# Altium schematic sheet Power-Sheet.SchDoc
size A4; SheetNumber: 2; SheetTotal: 11
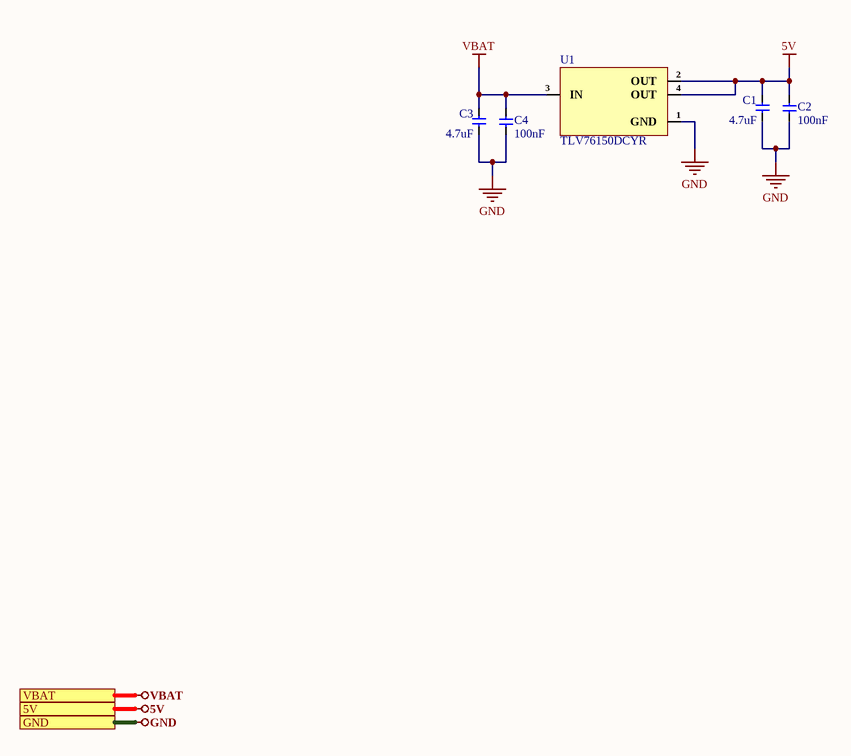
[diagram p0: Power-Sheet.SchDoc]

## Parts
C1  4.7uF  [Cap-0805]
C2  100nF  [cap-0402]
C3  4.7uF  [Cap-0805]
C4  100nF  [cap-0402]
U1  TLV76150DCYR  [SOT- 223]

## Ports
5V (see Top-Sheet[1A], Electrode-Sheet1[3D], Electrode-Sheet2[3D], Electrode-Sheet3[3D], Electrode-Sheet4[3D], Electrode-Sheet5[3D], Electrode-Sheet6[3D], Electrode-Sheet7[3D], Electrode-Sheet8[3D], Opamp-Sheet2[1D]), GND (see Top-Sheet[1A], Connector-Sheet[1D], Electrode-Sheet1[3D], Electrode-Sheet2[3D], Electrode-Sheet3[3D], Electrode-Sheet4[3D], Electrode-Sheet5[3D], Electrode-Sheet6[3D], Electrode-Sheet7[3D], Electrode-Sheet8[3D], Opamp-Sheet2[1D]), VBAT (see Top-Sheet[1A], Connector-Sheet[1D], Electrode-Sheet1[3D], Electrode-Sheet2[3D], Electrode-Sheet3[3D], Electrode-Sheet4[3D], Electrode-Sheet5[3D], Electrode-Sheet6[3D], Electrode-Sheet7[3D], Electrode-Sheet8[3D])

## Nets
5V: C1.1 C2.2 U1.2(OUT) U1.4(OUT) ; port 5V
GND: C1.2 C2.1 C3.2 C4.1 U1.1(GND) ; port GND
VBAT: C3.1 C4.2 U1.3(IN) ; port VBAT

## Notes on the sheet
- File:
- Title:
- Date:
- Page
- Num:
- Total:
- Drawn By: Huzaifa Ali

## Library data of the parts
C1 C3 = CL21B475KAFNNNE: CAP CER 4.7UF 25V X7R 0805; Manufacturer: Samsung; Item Type: Capacitors; Material: 4241ConductorMaterial; Tolerance: 10%; Supplier: Digikey; LCSC Part Number: C98195; Manufacturer Part Number: CL21B475KAFNNNE; RoHS: Yes; Stock: 74766; Pricing: 1=0.4, 10=0.246, 100=0.1664, 1000=0.1216 (USD); Mounting Technology: Surface Mount; Case/Package: 0805; Case Code (Metric): 2012; Case Code (Imperial): 0805; Min Operating Temperature: -55°C; Max Operating Temperature: 125°C; Packaging: Cut Tape; Value: 4.7uF; Voltage Rating: 25V; Voltage Rating (DC): 25V; Series: CL; Length: 0.079inch; Width: 0.049inch; Height: 1.45mm; Thickness: 0.053inch; Lead Free: Lead Free; RoHS Compliant: Yes; ComponentLink1URL: https://datasheet.ciiva.com/25711/cl21b475kafnnne-25711752.pdf?src-supplier=Digikey; ComponentLink1Description: https://datasheet.ciiva.com/25711/cl21b475kafnnne-25711752.pdf?src-supplier=Digikey
C2 C4 = C1005X7R1H104KT000F: CAP CER 0.1UF 50V X7R 0402; Manufacturer: TDK; Tolerance: 10%; Voltage: 25V; Item Type: Capacitor; Supplier 1: Avnet; Manufacturer Part Number: C1005X7R1H104KT000F; RoHS: No; Category: Ceramic Capacitors; Dielectric: X7R; Supplier Part Number 1: C1005X7R1H104KT000F; LCSC Part Number: C361198; ComponentLink1Description: LCSC; ComponentLink1URL: https://www.lcsc.com/product-detail/Multilayer-Ceramic-Capacitors-MLCC-SMD-SMT_TDK-C1005X7R1H104KT000F_C361198.html
U1 = TLV76150DCYR: IC REG LINEAR 5V 1A SOT-223-4; Manufacturer: Texas Instruments; Supplier: Mouser; LCSC Part Number: C5845194; Manufacturer Part Number: TLV76150DCYR; RoHS: No; Item Type: IC; Stock: 32246; Pricing: 1=0.5, 10=0.314, 50=0.314, 100=0.253, 1000=0.231, 10000=0.167 (USD)